# Altium schematic sheet [2] Power_Supply.SchDoc
size C; Organization: Altium Limited; Address1: L3, 12a Rodborough Rd; Address2: Frenchs Forest; Address3: NSW; Address4: Australia 2086
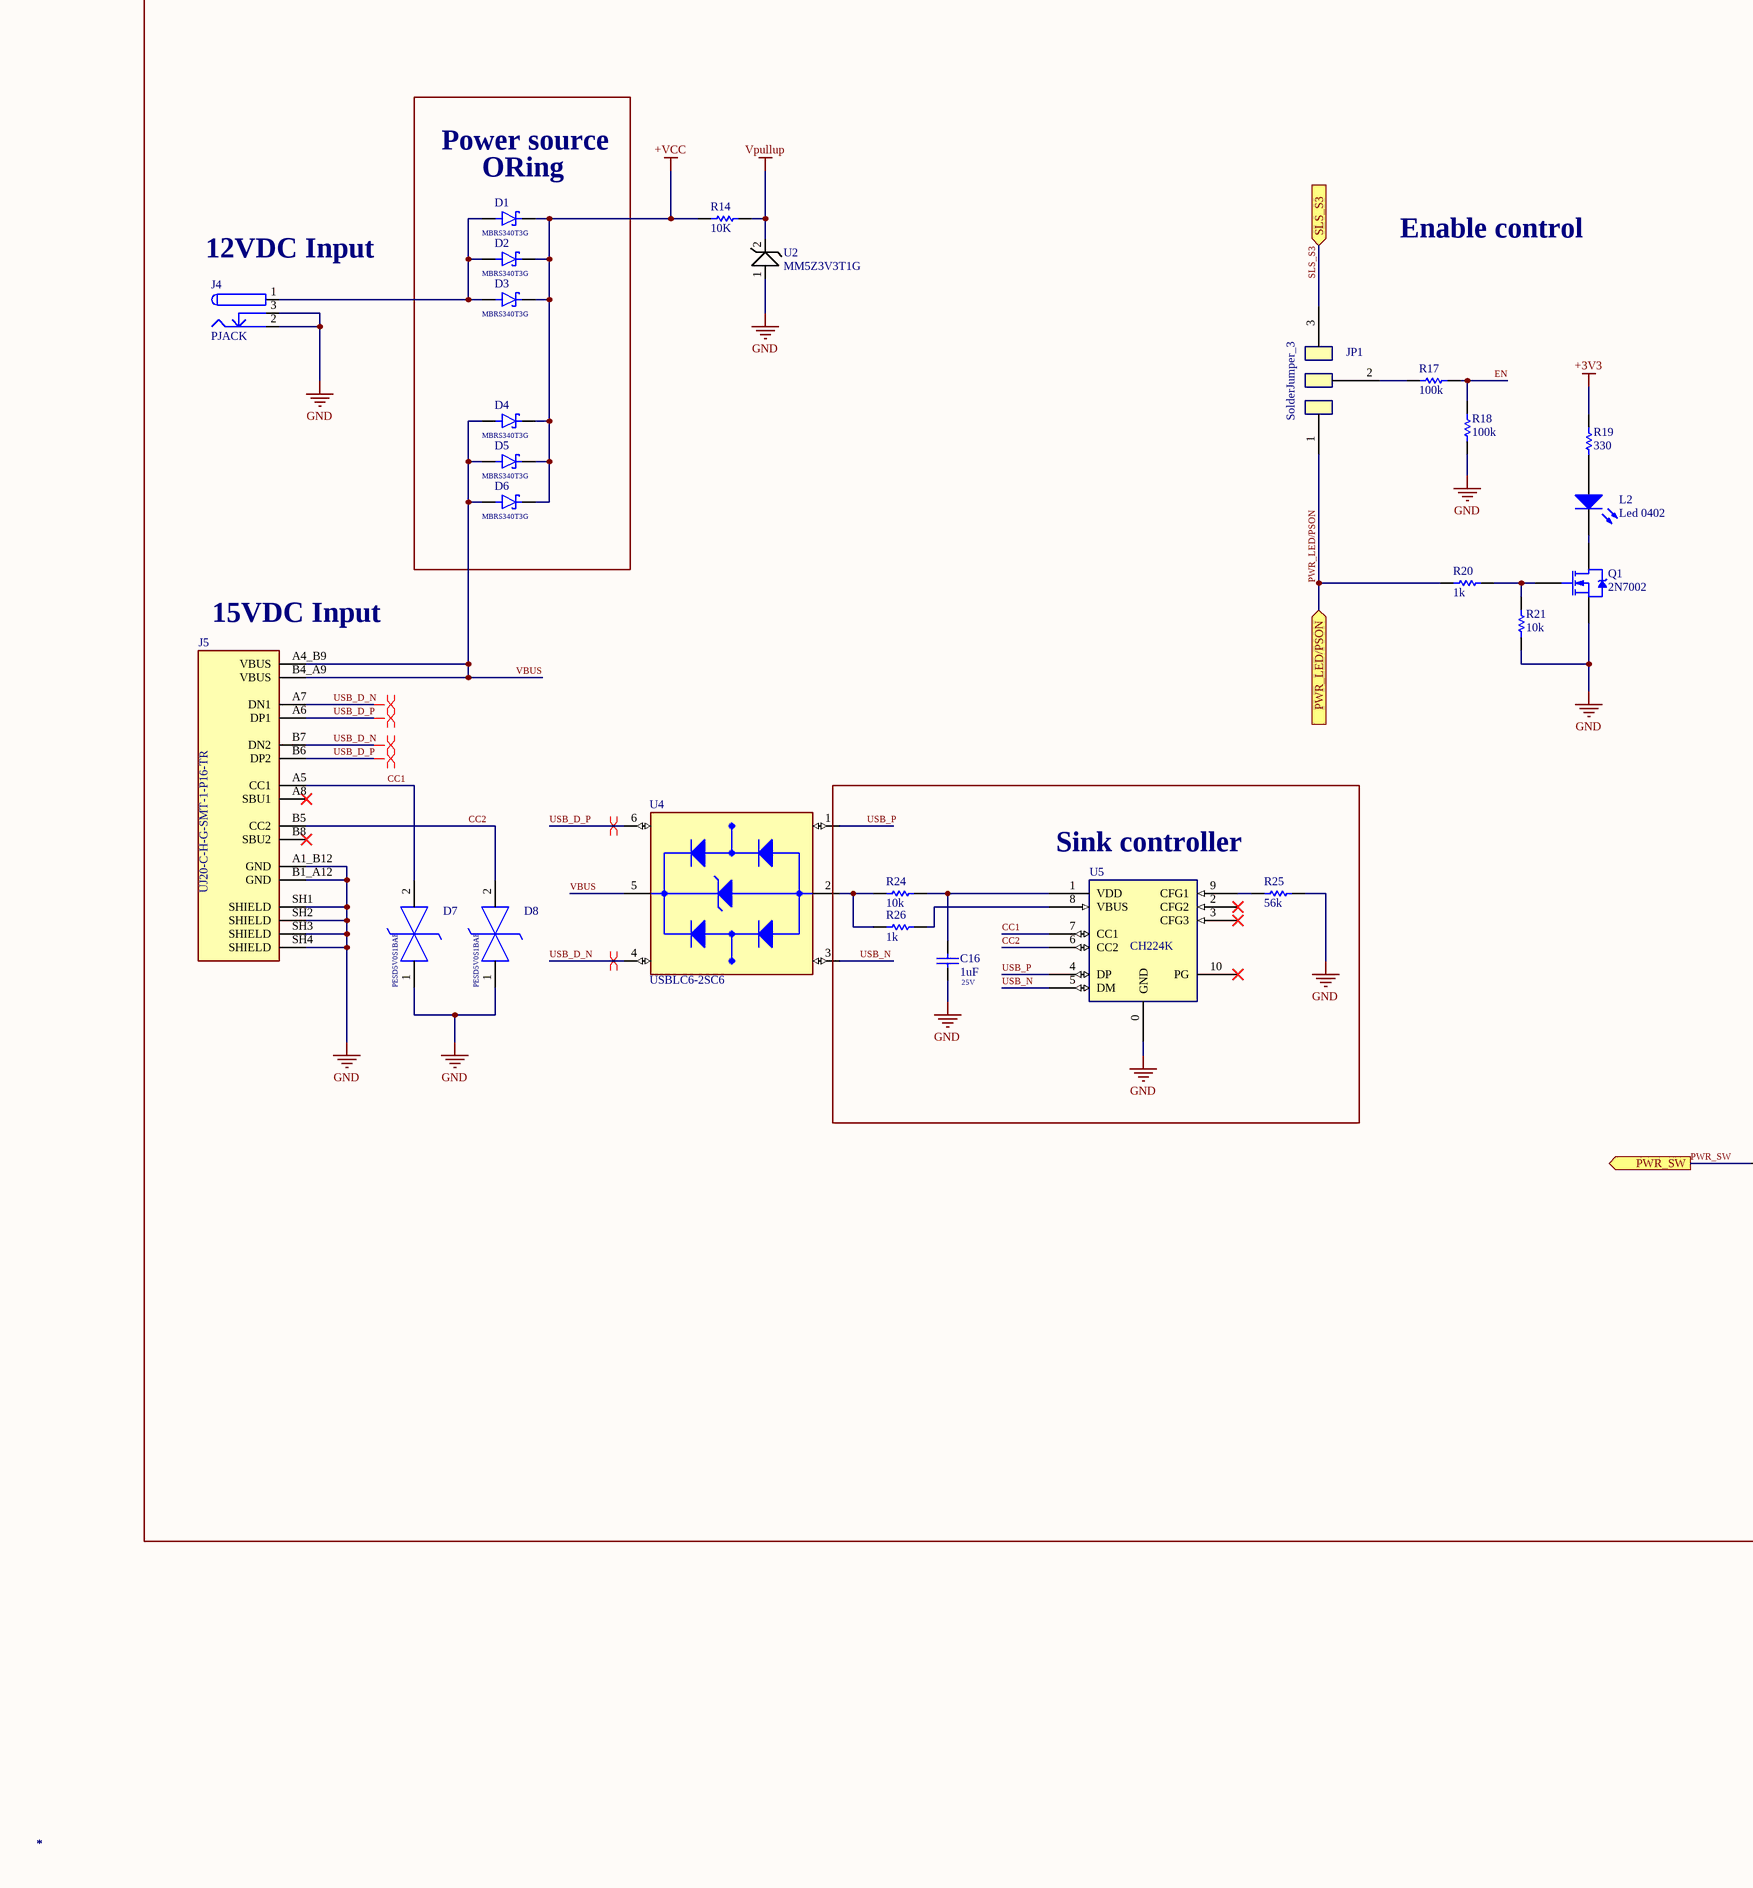
[diagram p0: [2] Power_Supply.SchDoc, left]
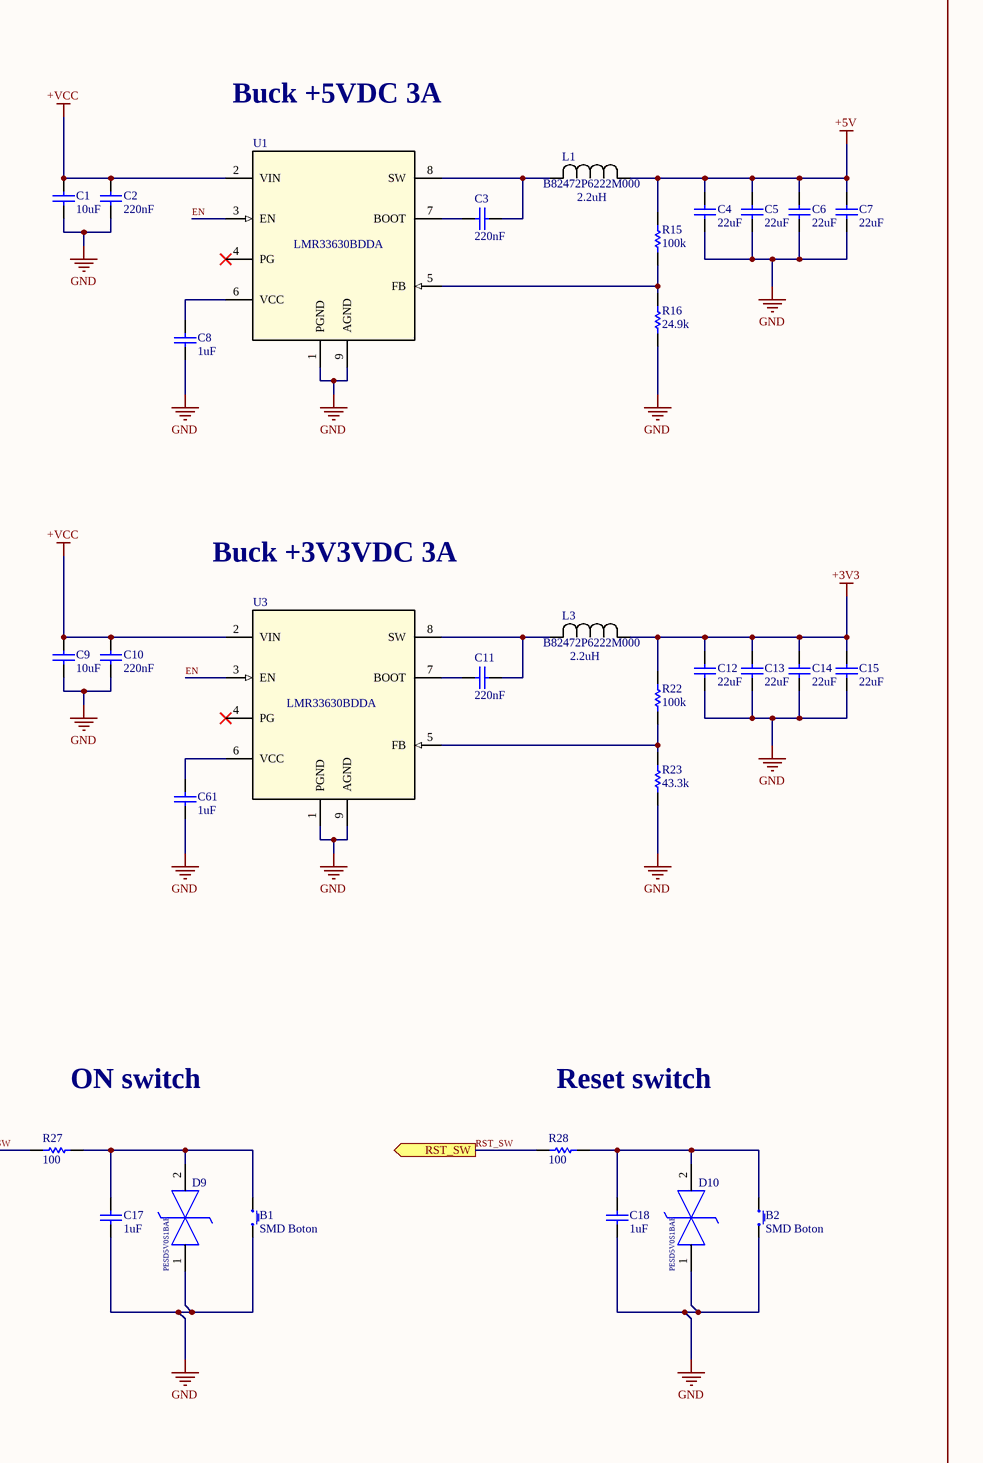
[diagram p1: [2] Power_Supply.SchDoc, right]

## Parts
B1  SMD Boton  [Push Boton Nano 2 Pin]
B2  SMD Boton  [Push Boton Nano 2 Pin]
C1  10uF  [CAPACITOR 0805]
C2  220nF  [Capacitor 0402]
C3  220nF  [Capacitor 0402]
C4  22uF  [Capacitor 0603]
C5  22uF  [Capacitor 0603]
C6  22uF  [Capacitor 0603]
C7  22uF  [Capacitor 0603]
C8  1uF  [Capacitor 0402]
C9  10uF  [CAPACITOR 0805]
C10  220nF  [Capacitor 0402]
C11  220nF  [Capacitor 0402]
C12  22uF  [Capacitor 0603]
C13  22uF  [Capacitor 0603]
C14  22uF  [Capacitor 0603]
C15  22uF  [Capacitor 0603]
C16  1uF  [Capacitor 0402]
C17  1uF  [Capacitor 0402]
C18  1uF  [Capacitor 0402]
C61  1uF  [Capacitor 0402]
D1  MBRS340T3G  [DIOM7959X261N]
D2  MBRS340T3G  [DIOM7959X261N]
D3  MBRS340T3G  [DIOM7959X261N]
D4  MBRS340T3G  [DIOM7959X261N]
D5  MBRS340T3G  [DIOM7959X261N]
D6  MBRS340T3G  [DIOM7959X261N]
D7  PESD5V0S1BAF  [SOD2512X110N]
D8  PESD5V0S1BAF  [SOD2512X110N]
D9  PESD5V0S1BAF  [SOD2512X110N]
D10  PESD5V0S1BAF  [SOD2512X110N]
J4  PJACK  [JACK DC]
J5  UJ20-C-H-G-SMT-1-P16-TR  [SAMESKY_UJ20-C-H-G-SMT-1-P16-TR]
JP1  (no value)  [SolderJumper-3_P1.3mm_Bridged12]
L1  B82472P6222M000  [IND_EPCOS_B82472P6_EPC]
L2  Led 0402  [LED 0402]
L3  B82472P6222M000  [IND_EPCOS_B82472P6_EPC]
Q1  2N7002  [SOT23127P600-8N]
R14  10K  [Resistencia 0402]
R15  100k  [Resistencia 0402]
R16  24.9k  [Resistencia 0402]
R17  100k  [Resistencia 0402]
R18  100k  [Resistencia 0402]
R19  330  [Resistencia 0402]
R20  1k  [Resistencia 0402]
R21  10k  [Resistencia 0402]
R22  100k  [Resistencia 0402]
R23  43.3k  [Resistencia 0402]
R24  10k  [Resistencia 0402]
R25  56k  [Resistencia 0402]
R26  1k  [Resistencia 0402]
R27  100  [Resistencia 0402]
R28  100  [Resistencia 0402]
U1  LMR33630BDDA  [DDA0008J]
U2  MM5Z3V3T1G  [SOD-523_0P9X1P3_ONS]
U3  LMR33630BDDA  [DDA0008J]
U4  USBLC6-2SC6  [SOT95P280X145-6N]
U5  (no value)  [ESSOP-10_CH224K]

## Blocks framed on the sheet
Sink controller: C16 R24-R26 U5

## Ports
PWR_LED/PSON (in), PWR_SW (out), RST_SW (out), SLS_S3 (in)

## Nets
+3V3: C12.2 C13.2 C14.2 C15.2 L3.1 R19.2(B) R22.2(B)
+5V: C4.2 C5.2 C6.2 C7.2 L1.1 R15.2(B)
+VCC: C1.2 C2.2 C9.2 C10.2 D1.C(K) D2.C(K) D3.C(K) D4.C(K) D5.C(K) D6.C(K) R14.1(A) U1.2(VIN) U3.2(VIN)
GND: B1.2 B2.2 C1.1 C2.1 C4.1 C5.1 C6.1 C7.1 C8.1 C9.1 C10.1 C12.1 C13.1 C14.1 C15.1 C16.1 C17.1 C18.1 C61.1 D7.1(K1) D8.1(K1) D9.1(K1) D10.1(K1) J4.2 J4.3 J5.A1_B12(GND) J5.B1_A12(GND) J5.SH1(SHIELD) J5.SH2(SHIELD) J5.SH3(SHIELD) J5.SH4(SHIELD) Q1.2(S) R16.1(A) R18.2(B) R21.1(A) R23.1(A) R25.2(B) U1.1(PGND) U1.9(AGND) U2.1(CATHODE) U3.1(PGND) U3.9(AGND) U5.0(GND)
Vpullup: R14.2(B) U2.2(ANODE)
CC1: D7.2(K2) J5.A5(CC1) U5.7(CC1)
CC2: D8.2(K2) J5.B5(CC2) U5.6(CC2)
EN: R17.1(A) R18.1(A) U1.3(EN) U3.3(EN)
PWR_LED/PSON: R20.2(B) ; port PWR_LED/PSON
PWR_SW: R27.2(B) ; port PWR_SW
RST_SW: R28.2(B) ; port RST_SW
SLS_S3: port SLS_S3
USB_D_N: J5.A7(DN1) J5.B7(DN2) U4.4(I/O2_OUT)
USB_D_P: J5.A6(DP1) J5.B6(DP2) U4.6(I/O1_OUT)
USB_N: U4.3(I/O2_IN) U5.5(DM)
USB_P: U4.1(I/O1_IN) U5.4(DP)
VBUS: D4.A D5.A D6.A J5.A4_B9(VBUS) J5.B4_A9(VBUS) U4.5(VBUS)
NetB1_1: B1.1 C17.2 D9.2(K2) R27.1(A)
NetB2_1: B2.1 C18.2 D10.2(K2) R28.1(A)
NetC3_1: C3.1 U1.7(BOOT)
NetC3_2: C3.2 L1.2 U1.8(SW)
NetC8_2: C8.2 U1.6(VCC)
NetC11_1: C11.1 U3.7(BOOT)
NetC11_2: C11.2 L3.2 U3.8(SW)
NetC16_2: C16.2 R24.2(B) U5.1(VDD)
NetC61_2: C61.2 U3.6(VCC)
NetD1_A: D1.A D2.A D3.A J4.1
NetL2_1: L2.1(A) R19.1(A)
NetL2_2: L2.2(K) Q1.3(D)
NetQ1_1: Q1.1(G) R20.1(A) R21.2(B)
NetR15_1: R15.1(A) R16.2(B) U1.5(FB)
NetR22_1: R22.1(A) R23.2(B) U3.5(FB)
NetR24_1: R24.1(A) R26.1(A) U4.2(GND)
NetR25_1: R25.1(A) U5.9(CFG1)
NetR26_2: R26.2(B) U5.8(VBUS)

Not connected (* = marked no-connect by the designer): J5 A8(SBU1)* B8(SBU2)*; JP1 1(A) 2(C) 3(B); R17 2(B); U1 4(PG)*; U3 4(PG)*; U5 2(CFG2)* 3(CFG3)* 10(PG)*

## Layout directives
differential pair: USB_D_N, USB_D_P

## Notes on the sheet
- Buck +5VDC 3A
- Power source
- (near D1) ORing
- (near J4) 12VDC Input
- Enable control
- (near L1) 2.2uH
- Buck +3V3VDC 3A
- (near J5) 15VDC Input
- (near L3) 2.2uH
- (near C16) 25V
- ON switch
- Reset switch
- Title
- Size:
- Date:
- File:
- C
- Number:
- Time:
- Revision:
- Sheet
- of

## Library data of the parts
B1 B2 = Push Boton 2 Pin SMD: Micro Push
C1 C9 = Capacitor 0805: Capacitor Cerámico SMD 0805
C2 C3 C8 C10 C11 C16-C18 C61 = Capacitor 0402: Capacitor Ceramico SMD 0402
C4-C7 C12-C15 = Capacitor 0603: Capacitor Ceramico SMD 0603
D1-D6 = MBRS340T3G: Diode Schottky 40 V 3A Surface Mount SMC; MF: ON Semiconductor; SnapEDA_Link: https://www.snapeda.com/parts/MBRS340T3G/Onsemi/view-part/?ref=snap; Package: SMC-2 ON Semiconductor; Value: *; MP: MBRS340T3G; Check_prices: https://www.snapeda.com/parts/MBRS340T3G/Onsemi/view-part/?ref=eda
D7-D10 = PESD5V0S1BAF: ESD Suppressors / TVS Diodes PESD5V0S1BA/SOD323/SOD2; Manufacturer_Name: Nexperia; Geometry.Height: 1.1mm; Mouser Part Number: 771-PESD5V0S1BAF; Mouser Price/Stock: https://www.mouser.co.uk/ProductDetail/Nexperia/PESD5V0S1BAF?qs=45Avz0nZxhtk8Fj2r0tKWQ%3D%3D; Manufacturer_Part_Number: PESD5V0S1BAF; Datasheet Link: https://assets.nexperia.com/documents/data-sheet/PESD5V0S1BA.pdf
J4 = JACK DC 2.1mm: Power Jack DC
J5 = UJ20-C-H-G-SMT-1-P16-TR: USB-C (USB TYPE-C) USB 2.0 Receptacle Connector 24 (16+8 Dummy) Position Surface Mount, Right Angle; Through Hole; MF: Same Sky; SnapEDA_Link: https://www.snapeda.com/parts/UJ20-C-H-G-SMT-1-P16-TR/Same+Sky/view-part/?ref=snap; Package: None; Value: *; MP: UJ20-C-H-G-SMT-1-P16-TR; Check_prices: https://www.snapeda.com/parts/UJ20-C-H-G-SMT-1-P16-TR/Same+Sky/view-part/?ref=eda
JP1 = SolderJumper_3: Solder jumper de 3 pads; Package: SolderJumper-3_P1.3mm
L1 L3 = B82472P6222M000: No Description Available; Manufacturer_Name: TDK Epcos; Copyright: Copyright (C) 2026 Ultra Librarian. All rights reserved.; Manufacturer_Part_Number: B82472P6222M000
L2 = LED 0402: LED SMD 0402
Q1 = 2N7002: Mosfet N SOT23
R14-R28 = Resistencia SMD 0402
U1 U3 = LMR33630BDDA: Reductor Reguladores de conmutación IC Positivo Ajuste 1V 1 Salida 3A 8-PowerSOIC (0.154", 3.90mm de ancho); Manufacturer_Name: Texas Instruments; Manufacturer_Part_Number: LMR33630ADDAR; TYPE: TYPE; RefDes: RefDes; Copyright: Copyright (C) 2026 Ultra Librarian. All rights reserved.
U2 = MM5Z3V3T1G: Description; Manufacturer_Name: onsemi; Copyright: Copyright (C) 2026 Ultra Librarian. All rights reserved.; Manufacturer_Part_Number: MM5Z3V3T1G; RefDes: RefDes; Type: Type
U4 = USBLC6-2SC6: 17V Clamp 5A (8/20Âµs) Ipp Tvs Diode Surface Mount SOT-23-6; MF: STMicroelectronics; Value: *; SnapEDA_Link: https://www.snapeda.com/parts/USBLC6-2SC6/STMicroelectronics/view-part/?ref=snap; Check_prices: https://www.snapeda.com/parts/USBLC6-2SC6/STMicroelectronics/view-part/?ref=eda; Purchase-URL: https://pricing.snapeda.com/search/part/USBLC6-2SC6/?ref=eda; Price: None; Availability: In Stock; Package: SOT-23-6 STMicroelectronics; MP: USBLC6-2SC6
U5 = CH224K: USB PD3.0/2.0 + BC1.2 sink controller, 100 W, ESSOP-10; Manufacturer: WCH (Jiangsu Qin Heng); Manufacturer Part Number: CH224K; Package: ESSOP-10-150mil-1mm